# Altium schematic sheet POWER_NEW.SchDoc
size A; SheetNumber: 4; SheetTotal: 4
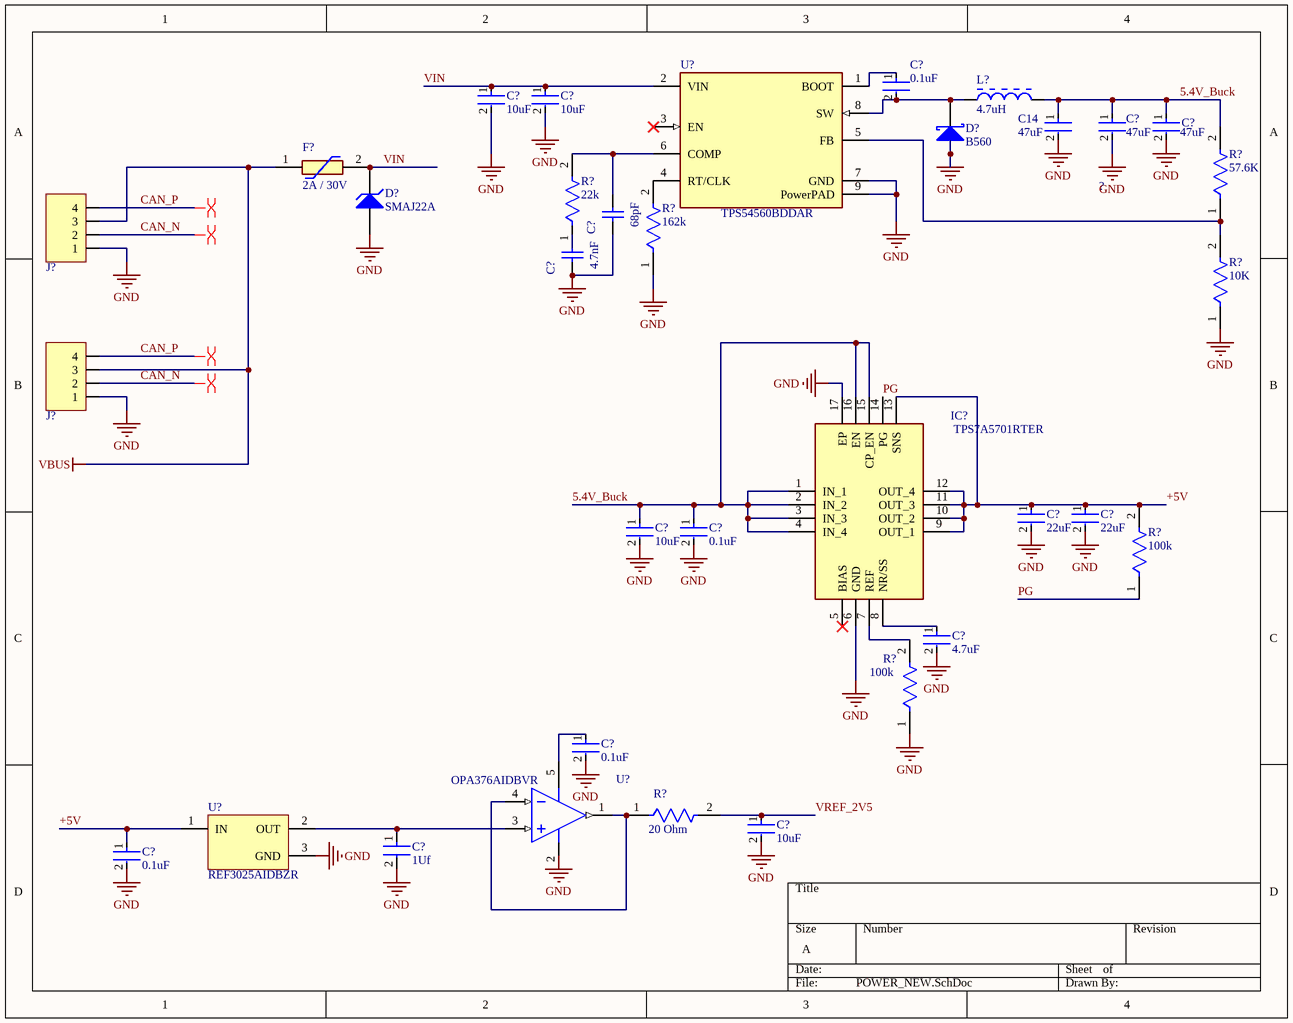
[diagram p0: POWER_NEW.SchDoc]

## Parts
(Parts that share a designator on the sheet are numbered #1, #2 ... from top to bottom, then left to right.)
?  47uF  [FP-ZRB18A-0_2-MFG]
C?#1  0.1uF  [FP-ZRB15X-0_22-MFG]
C?#2  10uF  [FP-ZRB15X-0_22-MFG]
C?#3  10uF  [FP-ZRB15X-0_22-MFG]
C?#4  47uF  [FP-ZRB18A-0_2-MFG]
C?#5  47uF  [FP-ZRB18A-0_2-MFG]
C?#6  68pF  [WCAP-CSMH_1808_H1.25]
C?#7  4.7nF  [WCAP-CSGP_0402_L1W0.5H0.5]
C?#8  22uF  [FP-GRM188-0_2-IPC_A]
C?#9  22uF  [FP-GRM188-0_2-IPC_A]
C?#10  10uF  [FP-ZRB15X-0_22-MFG]
C?#11  0.1uF  [FP-GRMJN6-0_1-MFG]
C?#12  4.7uF  [FP-GRM155-0_2-MFG]
C?#13  0.1uF  [FP-GRM022-0_02-IPC_C]
C?#14  10uF  [FP-ZRB15X-0_22-MFG]
C?#15  1Uf  [FP-RCE1K1-MFG]
C?#16  0.1uF  [FP-GRM022-0_02-IPC_C]
D?#1  B560  [DIOD-B5X0C-2_M]
D?#2  SMAJ22A  [LFUS-DO-214AC-2_L]
F?  2A / 30V  [MFLSMF20033X2]
IC?  TPS7A5701RTER  [QFN50P300X300X80-17N-D]
J?#1  Microfit+ R/A  [CONN_MOLEX_MICROFIT+_4_POS_R/A - duplicate]  (value not drawn)
J?#2  Microfit+ R/A  [CONN_MOLEX_MICROFIT+_4_POS_R/A - duplicate]  (value not drawn)
L?  4.7uH  [BOUR-SRN3015-2_V]
R?#1  57.6K  [FP-AC0402-IPC_B]
R?#2  22k  [FP-CRGP0603-IPC_C]
R?#3  162k  [FP-RP73P-1E-MFG]
R?#4  10K  [FP-AC0603-IPC_A]
R?#5  100k  [FP-CRGCQ2512-IPC_C]
R?#6  100k  [FP-CRGCQ2512-IPC_C]
R?#7  20 Ohm  [FP-AF0201-IPC_A]
U?#1  TPS54560BDDAR  [FP-DDA0008E-MFG]
U?#2  OPA376AIDBVR  [DBV0005A_L]
U?#3  REF3025AIDBZR  [DBZ0003A_L]

## Nets
GND: ?.2 C?#2.2 C?#3.2 C?#4.2 C?#5.2 C?#6.1 C?#7.1 C?#8.2 C?#9.2 C?#10.2 C?#11.2 C?#12.2 C?#13.2 C?#14.2 C?#15.2 C?#16.2 D?#1.2(A) D?#2.1(A) IC?.6(GND) IC?.17(EP) J?#1.1 J?#2.1 R?#3.1 R?#4.1 R?#6.1 U?#1.7(GND) U?#1.9(PowerPAD) U?#3.3(GND)
VBUS: F?.1 J?#1.3 J?#2.3
5.4V_Buck: ?.1 C?#4.1 C?#5.1 C?#10.1 C?#11.1 IC?.1(IN_1) IC?.2(IN_2) IC?.3(IN_3) IC?.4(IN_4) IC?.15(CP_EN) IC?.16(EN) L?.2 R?#1.2
+5V: C?#8.1 C?#9.1 C?#16.1 IC?.9(OUT_1) IC?.10(OUT_2) IC?.11(OUT_3) IC?.12(OUT_4) IC?.13(SNS) R?#5.2 U?#3.1(IN)
CAN_N: J?#1.2 J?#2.2
CAN_P: J?#1.4 J?#2.4
PG: IC?.14(PG) R?#5.1
VIN: C?#2.1 C?#3.1 D?#2.2(K) F?.2 U?#1.2(VIN)  [also labelled VIN  ]
VREF_2V5: C?#14.1 R?#7.2
NetC?#1_1: C?#1.1 U?#1.1(BOOT)
NetC?#1_2: C?#1.2 D?#1.1(K) L?.1 U?#1.8(SW)
NetC?#6_2: C?#6.2 R?#2.2 U?#1.6(COMP)
NetC?#7_2: C?#7.2 R?#2.1
NetC?#12_1: C?#12.1 IC?.8(NR/SS)
NetC?#13_1: C?#13.1 U?#2.5(V+)
NetC?#15_1: C?#15.1 U?#2.3(IN+) U?#3.2(OUT)
NetIC?_7: IC?.7(REF) R?#6.2
NetR?#1_1: R?#1.1 R?#4.2 U?#1.5(FB)
NetR?#3_2: R?#3.2 U?#1.4(RT/CLK)
NetR?#7_1: R?#7.1 U?#2.1(OUT) U?#2.4(IN-)

Not connected (* = marked no-connect by the designer): IC? 5(BIAS)*; U?#1 3(EN)*; U?#2 2(V-)

## Layout directives
differential pair: CAN_N, CAN_P

## Notes on the sheet
- C14
- Labels drawn without touching a wire or pin: GND

## Library data of the parts
? C?#4 C?#5 = CMP-06035-063273-1: Low Acoustic Noise Chip Multilayer Ceramic Capacitors on Interposer Board for General Purpose 	47μF ±20% 2.5VDC SMD 0603
C?#1-C?#3 C?#10 C?#14 = CMP-06035-063245-1: Multilayer Ceramic Capacitors on Interposer Board for General Purpose 10μF ±20% 4VDC X6S  SMD  0402
C?#6 = CMP-03913-89205720-2: Cap Ceramic 68pF 3000V C0G 5% Pad SMD 1808 125C T/R; Insulation Resistance: 10GΩ; Voltage Rating (DC): 3kV; Voltage Rating: 3kV; Min Operating Temperature: -55°C; Length: 4.5mm; Max Operating Temperature: 125°C; RoHS: Compliant; Width: 2.03mm; Capacitance: 68pF; Height: 1.25mm
C?#7 = CMP-03913-53703202-2: Cap Ceramic 0.0047uF 50V X7R 10% Pad SMD 0402 125C T/R; Insulation Resistance: 10GΩ; Material: Ceramic; Tolerance: 10%; Length: 1mm; RoHS: Compliant; Max Operating Temperature: 125°C; Capacitance: 4.7nF; Voltage Rating: 50V; Case/Package: 0402; Width: 500µm; Mount: Surface Mount; Min Operating Temperature: -55°C; Case Code (Imperial): 0402; Height: 500µm; Packaging: Tape & Reel (TR); Thickness: 558.8µm; Case Code (Metric): 1005
C?#8 C?#9 = CMP-06035-063568-1: Multilayer Ceramic Capacitor 22uF 20% 6.3V X7T 0603 Paper T/R
C?#11 = CMP-00260-135708739-1: GRMJN65C1H104JE01D Multilayer Ceramic Capacitor, 0.1 uF, 50 V, ± 5%, C0G (NP0), 0704 [1810 Metric]; Temperature Coefficient: 30ppm/°C; Capacitance: 100nF; Voltage Rating: 50V; Tolerance: 5%; Min Operating Temperature: -55°C; Case/Package: 0704; Material: Ceramic; NexarPartId: 135708739; Height: 650µm; Lifecycle Status: Production; Max Operating Temperature: 125°C
C?#12 = CMP-00260-151029462-1: GRM155C80J475ME01D; Voltage Rating (DC): 6.3V; Capacitance: 4.7µF; Dielectric: X6S; Length: 1mm; Case/Package: 0402; Width: 500µm; NexarPartId: 151029462; Thickness: 500µm
C?#13 C?#16 = CMP-06035-051810-1: Chip Multilayer Ceramic Capacitors for General Purpose, 01005, 0.10uF, X5R, 15%, 20%, 10V
C?#15 = CMP-00260-148573931-1: RCEC72A105K1K1H03B; Capacitance: 1µF; Tolerance: 10%; Material: Ceramic; Voltage Rating: 100V; Min Operating Temperature: -55°C; Case/Package: Radial; Max Operating Temperature: 125°C; Lifecycle Status: Production; Height: 5mm
D?#1 = CMP-2000-05098-2: Schottky Barrier Rectifier, 5 A, 60 V, -55 to 125 degC, 2-Pin SMD, RoHS, Tape and Reel; Ir - Reverse Current: 500uA; Configuration: Single; Ifsm - Forward Surge Current: 100A; Vrrm - Repetitive Reverse Voltage: 60V; Brand: DiodesIncorporated; Vf - Forward Voltage: 0.7V; If - Forward Current: 5A; Unit Weight: 0.007408oz; Type: SchottkyBarrierRectifier; Package / Case: SMC; Manufacturer URL: http://www.diodes.com/; Datasheet URL: https://datasheet.ciiva.com/27052/1538961-27052355.pdf; Factory Pack Quantity: 3000; Height: 2.5mm; Width: 6.22mm; Product Category: SchottkyDiodes&Rectifiers; Minimum Operating Temperature: -55C; Manufacturer: DiodesIncorporated; Datasheet Version: Rev. 7-2, 06/2007; Product: SchottkyDiodes; Maximum Operating Temperature: +125C; Operating Temperature Range: -55Cto+125C; Technology: Si; Length: 7.11mm; RoHS: True; Packaging: Reel; Termination Style: SMD/SMT; Series: B560; Mounting Style: SMD/SMT
D?#2 = CMP-2000-07086-1: Transient Voltage Suppression Diode, 400 W, 22 V, -65 to 150 degC, 2-Pin SMD, RoHS, Tape and Reel; Manufacturer: Littelfuse; Power Dissipation: 400W; Directional: Uni-Directional; Breakdown Voltage-Min: 24.4V; Clamping Voltage-Max: 35.5V; Breakdown Voltage-Max: 26.9V; Manufacturer URL: http://www.littelfuse.com/; Datasheet Version: 11/2015; Package Reference: DO-214AC; Package Description: 2-Pin Surface Mount Device, Body 4.295 x 2.595 mm; Datasheet URL: http://www.littelfuse.com/~/media/electronics/datasheets/tvs_diodes/littelfuse_tvs_diode_smaj_datasheet.pdf.pdf; Mounting Technology: SurfaceMount
F? = MF-LSMF200_33X-2: Resettable Fuse; Manufacturer_Name: Bourns; Manufacturer_Part_Number: MF-LSMF200/33X-2; Datasheet Link: https://www.bourns.com/docs/product-datasheets/mf-lsmf.pdf; Height: 1.6mm
IC? = TPS7A5701RTER: Integrated Circuit; Manufacturer_Name: Texas Instruments; Datasheet Link: https://www.mouser.in/ProductDetail/Texas-Instruments/TPS7A5701RTER?qs=vvQtp7zwQdOmK5SKE0o8WA%3D%3D; Height: 0.8mm; Manufacturer_Part_Number: TPS7A5701RTER; Mouser Part Number: 595-TPS7A5701RTER; Mouser Price/Stock: https://www.mouser.co.uk/ProductDetail/Texas-Instruments/TPS7A5701RTER?qs=vvQtp7zwQdOmK5SKE0o8WA%3D%3D
J?#1 J?#2 = CONN_MOLEX_MICROFIT+_4POS_R/A: Molex Microfit+ / 212528 4 POS R/A Black; Pitch: 3.0mm; Current Per Pin: 12.5A; Manufacturer: Molex; Supplier 1: Digikey; Supplier Part Number 1: 900-2125280400-ND; Configuration: R/A; Color: Black
L? = CMP-0007-00005-1: Semi-shielded Power Inductor, 4.7 uH, +/- 20%, 1.4 A, -40 to 125 degC, 3 x 3 x 1.5 mm SMD, RoHS and Halogen Free, Tape and Reel; Manufacturer: Bourns; PartNumber: SRN3015-4R7M; SRF Min: 65 MHz; Isat: 1.2 A; Resistance to Solder Heat: +260 degC for 10 sec.; Rated current: 1.4 A; Inductance tolerance: +/- 20%; DCR Max: 0.136 Ohm; RoHS: TRUE; Inductance: 4.7 uH; ComponentLink2Description: Datasheet; PackageDescription: 2-Pin SMD, Body 3 x 3 mm, Height 1.5 mm; ComponentLink2URL: http://www.bourns.com/data/global/pdfs/SRN3015.pdf; ComponentLink1URL: http://www.bourns.com/; Packing: Tape and Reel; Mounting Technology: Surface Mount; ComponentLink3URL: http://www.bourns.com/data/global/pdfs/SRN3015.pdf; PackageReference: SRN3015; Operating Temperature: -40 to 125 degC; DatasheetVersion: Aug-11; ComponentLink1Description: Manufacturer URL; ComponentLink3Description: Package Specification
R?#1 = CMP-03412-018110-2: RES 576kΩ ±1% 0.063W 0402; RoHS Compliant: Yes
R?#2 = CMP-03211-006681-1: CRGP 0603 22K 1%; Manufacturer Part Number: CRGP0603F22K; Manufacturer: TE; Resistance: 22KΩ; Power Rating: 0.25W; Temperature Coefficient: ±100ppm/°C; Tolerance: 0.01; Voltage Rating: 50V; Value: 22KΩ; Lead Free: Yes; Device Class L3: Chip SMD Resistors; Ipc Land Pattern Name: RESC16080X45; Composition: Thick Film; Octopart: https://octopart.com/crgp0603f22k-te+connectivity-91018742; RoHS: TRUE; ComponentLink2Description: Datasheet; Digikey Description: CRGP 0603 22K 1%; Category: Res; Temperature: -55°C to +155°C; Temperature Range High: +155°C; Series: CRGP; ComponentLink2URL: https://www.te.com/commerce/DocumentDelivery/DDEController?Action=srchrtrv&DocNm=9-1773463-9&DocType=DS&DocLang=English; Device Class L2: Resistors; Height: 0.55mm; Ambient Temperature Range High: +70°C; Device Class L1: Passive Components; Automotive: No; Temperature Range Low: -55°C; Package: CRGP0603
R?#3 = CMP-03211-007818-1: RP73P 0402 162KΩ 0.1W 25ppm/°C 0.10% 50V; Manufacturer Part Number: RP73PF1E162KBTD; Manufacturer: TE Connectivity; Temperature Range High: +155°C; Device Class L1: Passive Components; Voltage Rating: 50V; Category: Res; Ipc Land Pattern Name: RESC10050X30; RoHS: TRUE; Resistance: 162KΩ; Device Class L3: Chip SMD Resistors; Octopart: https://octopart.com/rp73pf1e162kbtd-te+connectivity-89229970; Value: 162KΩ; Lead Free: Yes; Device Class L2: Resistors; ComponentLink2URL: https://www.te.com/commerce/DocumentDelivery/DDEController?Action=srchrtrv&DocNm=1773272&DocType=DS&DocLang=English; Automotive: No; Package: RP73P-1E; Tolerance: 0.10%; ComponentLink2Description: Datasheet; Height: 0.35mm; Temperature: -55°C to +155°C; Series: RP73P; Power Rating: 0.1W; Temperature Coefficient: 25ppm/°C; Composition: Thin Film; Temperature Range Low: -55°C
R?#4 = CMP-03412-040683-1: RES 10kΩ 5.00% 0.2W 0603
R?#5 R?#6 = CMP-03211-002138-1: CRGCQ2512 100KΩ 1W ±100ppm/°C 1%200V; Manufacturer Part Number: CRGCQ2512F100K; Manufacturer: TE Connectivity; Voltage Rating: 200V; Tolerance: 0.01; Automotive Grade: Grade 0; Temperature Coefficient: ±100ppm/°C; Temperature Range High: +155°C; Lead Free: Yes; Device Class L2: Resistors; Temperature Range Low: -55°C; Automotive: Yes; Package: CRGCQ2512; RoHS: TRUE; Octopart: https://octopart.com/crgcq2512f100k-te+connectivity-91018554; Device Class L1: Passive Components; Height: 0.65mm; Category: Res; Value: 100KΩ; Temperature: -55°C to +155°C; Ipc Land Pattern Name: RESC635320X55; Device Class L3: Chip SMD Resistors; ComponentLink2URL: https://www.te.com/commerce/DocumentDelivery/DDEController?Action=showdoc&DocId=Data+Sheet%7F1773204-3%7F1%7Fpdf%7FEnglish%7FENG_DS_1773204-3_1.pdf%7F4-2176349-1150; Power Rating: 1W; ComponentLink2Description: Datasheet; Series: CRGCQ; Resistance: 100KΩ; Composition: Thick Film
R?#7 = CMP-03412-047168-1: Anti-Sulfurated Chip Resistors Automotive Grade 20Ω 5% 200ppm/°C 0201; Max Power Dissipation: 50mW; Resistance: 20R; Temperature Coefficient: 200ppm/°C; Height: 0.01inch; Packaging: Tape and Reel; Case/Package: 0201; Number of Terminations: 2; Length: 0.024inch; Series: AF; Max Operating Temperature: 125°C; Resistor Type: Thick Film; Min Operating Temperature: -55°C; Features: Moisture Resistant; Width: 0.012inch; Tolerance: 5%; RoHS Compliant: Yes
U?#1 = CMP-04918-000346-1: IC REG CTRLR
U?#2 = CMP-0272-00842-3: Precision, Low Noise, Low Iq Operational Amplifier, 2.2 to 5.5 V, -40 to 125 degC, 5-pin SOT23 (DBV5), Green (RoHS & no Sb/Br); Manufacturer: Texas Instruments; Offset Drift(Typ)(uV/C): 0.32; Iq per channel(Max)(mA): 0.95; Vn at 1kHz(Typ)(nV/rtHz): 7.5; Total Supply Voltage(Min)(+5V is 5, +/-5V is 10): 2.2; Number of Channels: 1; Slew Rate(Typ)(V/us): 2; CMRR(Min)(dB): 76; Total Supply Voltage(Max)(+5V is 5, +/-5V is 10): 5.5; Vio (25C)(Max)(mV): 0.025; IIB(Max)(pA): 10; Sub Family: Low Input Bias Current Amp (<=10pA), Low Noise Amp (<=10nV/rtHz), Low Offset Voltage Amplifier (<=500uV), Low Supply Voltage Amplifier (<=2.7V), Precision Amplifier; Code_JEDEC: MO-178; DatasheetVersion: SBOS406F; ComponentLink3Description: Package Specification; PackageVersion: 4073253-4/K, 03/2006; ComponentLink2Description: Datasheet; PackageDescription: 5-Pin Plastic Small Outline, Body 1.6 x 2.9 mm, Pitch 0.95 mm; ComponentLink1URL: http://www.ti.com/; Mounting Technology: Surface Mount; PartNumber: OPA376AIDBVR; ComponentLink1Description: Manufacturer URL; ComponentLink3URL: http://www.ti.com/litv/pdf/mpds018i; PackageReference: DBV0005A; ComponentLink2URL: http://www.ti.com/general/docs/lit/getliterature.tsp?genericPartNumber=OPA376&fileType=pdf; Eco-Plan: Green (RoHS & no Sb/Br)
U?#3 = CMP-0367-00155-2: 2.5 V, 50 ppm / degC, 50 uA Series (Bandgap) Voltage Reference, -40 to 125 degC, 3-pin SOT-23 (DBZ), Green (RoHS & no Sb/Br); Manufacturer: Texas Instruments; SubFamily: Series Voltage Reference; Initial Accuracy @ 25/deg C(%): 0.2; Temp Coeff(Max)(ppm/ degree C): 50; VI(Min)(V): 2.501; Temp Coeff(Typ)(ppm/ degree C): 20; VI(Max)(V): 5.5; VO(V): 2.5; Rating: Catalog; Eco-Plan: Green (RoHS & no Sb/Br); ComponentLink1URL: http://www.ti.com/; ComponentLink2Description: Datasheet; Code_JEDEC: TO-236; ComponentLink3Description: Package Specification; Iq(Max)(uA): 50; ComponentLink1Description: Manufacturer URL; ComponentLink3URL: http://www.ti.com/litv/pdf/mpds108a; ComponentLink2URL: http://www.ti.com/general/docs/lit/getliterature.tsp?genericPartNumber=REF3025&fileType=pdf; Mounting Technology: Surface Mount; PartNumber: REF3025AIDBZR; DatasheetVersion: SBVS032F; PackageVersion: 4203227/B; PackageDescription: 3-Pin Plastic Small Outline, Body 2.92 x 1.3 mm, Pitch 0.95 mm; PackageReference: DBZ0003A